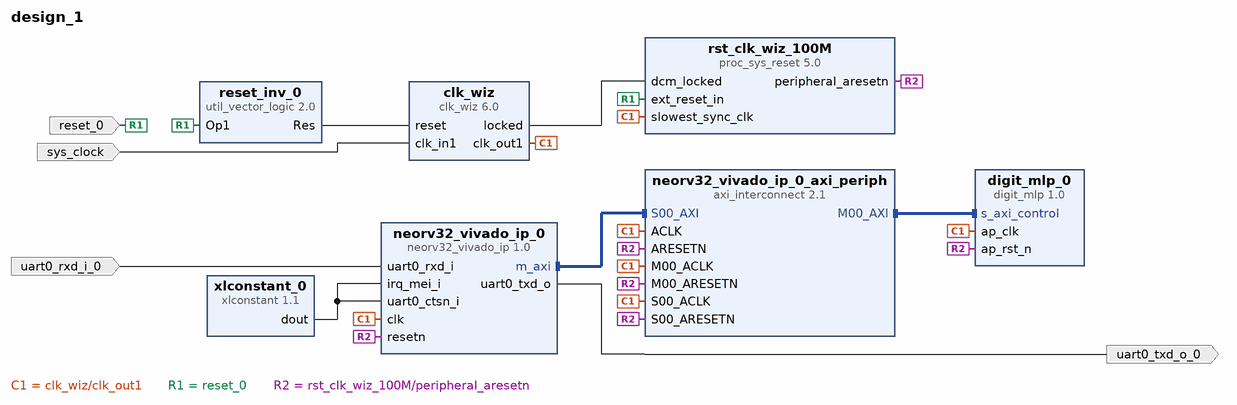
[diagram p0: block diagram of the top level]
# Vivado block design design_1, xc7a35ticsg324-1L, Vivado 2023.1
create_bd_design design_1

create_bd_port -dir O uart0_txd_o_0
create_bd_port -dir I uart0_rxd_i_0
create_bd_port -dir I -type clk sys_clock
set_property -dict {CONFIG.FREQ_HZ 100000000 CONFIG.PHASE 0.0} [get_bd_ports sys_clock]
create_bd_port -dir I -type rst reset_0
set_property -dict {CONFIG.POLARITY ACTIVE_LOW} [get_bd_ports reset_0]

create_bd_cell -type ip -vlnv NEORV32:user:neorv32_vivado_ip:1.0 neorv32_vivado_ip_0
set_property -dict [list \
  CONFIG.CACHE_BURSTS_EN false \
  CONFIG.DMEM_EN true \
  CONFIG.DMEM_SIZE 32768 \
  CONFIG.IMEM_EN true \
  CONFIG.IMEM_SIZE 32768 \
  CONFIG.IO_CLINT_EN true \
  CONFIG.IO_UART0_EN true \
  CONFIG.IO_UART0_RX_FIFO 16 \
  CONFIG.IO_UART0_TX_FIFO 16 \
  CONFIG.RISCV_ISA_C true \
  CONFIG.RISCV_ISA_M true \
  CONFIG.RISCV_ISA_Zcb false \
  CONFIG.RISCV_ISA_Zicntr true \
  CONFIG.XBUS_EN true \
] [get_bd_cells neorv32_vivado_ip_0]
create_bd_cell -type ip -vlnv xilinx.com:ip:axi_interconnect:2.1 neorv32_vivado_ip_0_axi_periph
set_property -dict {CONFIG.NUM_MI 1} [get_bd_cells neorv32_vivado_ip_0_axi_periph]
create_bd_cell -type ip -vlnv xilinx.com:ip:clk_wiz:6.0 clk_wiz
set_property -dict [list \
  CONFIG.CLK_IN1_BOARD_INTERFACE sys_clock \
  CONFIG.RESET_BOARD_INTERFACE reset \
  CONFIG.USE_BOARD_FLOW true \
] [get_bd_cells clk_wiz]
create_bd_cell -type ip -vlnv xilinx.com:ip:proc_sys_reset:5.0 rst_clk_wiz_100M
set_property -dict {CONFIG.RESET_BOARD_INTERFACE reset CONFIG.USE_BOARD_FLOW true} [get_bd_cells rst_clk_wiz_100M]
create_bd_cell -type ip -vlnv xilinx.com:ip:util_vector_logic:2.0 reset_inv_0
set_property -dict {CONFIG.C_OPERATION not CONFIG.C_SIZE 1} [get_bd_cells reset_inv_0]
create_bd_cell -type ip -vlnv xilinx.com:ip:xlconstant:1.1 xlconstant_0
set_property -dict {CONFIG.CONST_VAL 0} [get_bd_cells xlconstant_0]
create_bd_cell -type ip -vlnv xilinx.com:hls:digit_mlp:1.0 digit_mlp_0

# ---- connections ----

connect_bd_intf_net [get_bd_intf_pins neorv32_vivado_ip_0_axi_periph/M00_AXI] [get_bd_intf_pins digit_mlp_0/s_axi_control]
connect_bd_intf_net [get_bd_intf_pins neorv32_vivado_ip_0/m_axi] [get_bd_intf_pins neorv32_vivado_ip_0_axi_periph/S00_AXI]
connect_bd_net [get_bd_pins clk_wiz/clk_out1] \
  [get_bd_pins neorv32_vivado_ip_0/clk] [get_bd_pins neorv32_vivado_ip_0_axi_periph/S00_ACLK] \
  [get_bd_pins rst_clk_wiz_100M/slowest_sync_clk] [get_bd_pins neorv32_vivado_ip_0_axi_periph/M00_ACLK] \
  [get_bd_pins neorv32_vivado_ip_0_axi_periph/ACLK] [get_bd_pins digit_mlp_0/ap_clk]
connect_bd_net [get_bd_pins clk_wiz/locked] [get_bd_pins rst_clk_wiz_100M/dcm_locked]
connect_bd_net [get_bd_pins neorv32_vivado_ip_0/uart0_txd_o] [get_bd_ports uart0_txd_o_0]
connect_bd_net -net reset_0_1 [get_bd_ports reset_0] [get_bd_pins rst_clk_wiz_100M/ext_reset_in] [get_bd_pins reset_inv_0/Op1]
connect_bd_net [get_bd_pins reset_inv_0/Res] [get_bd_pins clk_wiz/reset]
connect_bd_net [get_bd_pins rst_clk_wiz_100M/peripheral_aresetn] \
  [get_bd_pins neorv32_vivado_ip_0/resetn] [get_bd_pins neorv32_vivado_ip_0_axi_periph/S00_ARESETN] \
  [get_bd_pins neorv32_vivado_ip_0_axi_periph/M00_ARESETN] [get_bd_pins neorv32_vivado_ip_0_axi_periph/ARESETN] \
  [get_bd_pins digit_mlp_0/ap_rst_n]
connect_bd_net [get_bd_ports sys_clock] [get_bd_pins clk_wiz/clk_in1]
connect_bd_net -net uart0_rxd_i_0_1 [get_bd_ports uart0_rxd_i_0] [get_bd_pins neorv32_vivado_ip_0/uart0_rxd_i]
connect_bd_net [get_bd_pins xlconstant_0/dout] [get_bd_pins neorv32_vivado_ip_0/irq_mei_i] [get_bd_pins neorv32_vivado_ip_0/uart0_ctsn_i]

# ---- address map ----
assign_bd_address -offset 0x44A00000 -range 64K -target_address_space [get_bd_addr_spaces neorv32_vivado_ip_0/m_axi] [get_bd_addr_segs digit_mlp_0/s_axi_control/Reg]

validate_bd_design
save_bd_design
